# Altium project hub_usb_2_0_3_0.PrjPcb
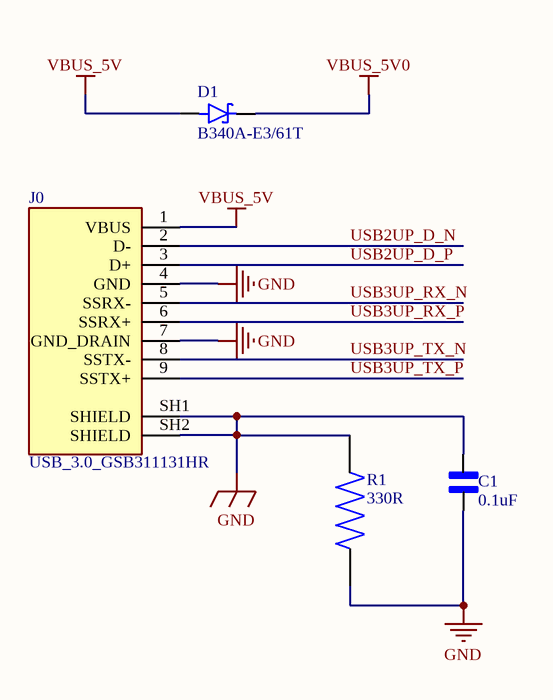
[diagram p0: type_A_input.SchDoc]
4 sheets, 101 parts. Net scope: global (net labels, ports and power ports of the same name join across sheets).
Board file: hub_usb.PcbDoc
Sheets:
  type_A_input.SchDoc
  Nguon.SchDoc
  vi_dieu_khien.SchDoc
  type_A_output.SchDoc

## Sheet type_A_input.SchDoc
size A; SheetNumber: 1; SheetTotal: 4

### Parts
C1  0.1uF  [CAPC1608X94N]
D1  B340A-E3/61T  [DIOM5126X229N]
J0  USB_3.0_GSB311131HR  [USB 3.0]
R1  330R  [RES_ERJU03J474V]

### Nets
GND: C1.1 C1.2 J0.4(GND) J0.7(GND_DRAIN) J0.SH1(SHIELD) J0.SH2(SHIELD) R1.1 R1.2
VBUS_5V: D1.A J0.1(VBUS)
VBUS_5V0: D1.C
USB2UP_D_N: J0.2(D-)
USB2UP_D_P: J0.3(D+)
USB3UP_RX_N: J0.5(SSRX-)
USB3UP_RX_P: J0.6(SSRX+)
USB3UP_TX_N: J0.8(SSTX-)
USB3UP_TX_P: J0.9(SSTX+)

### Library data of the parts
C1 = cap_0603_VJ0603D3R9DXCAP: cap 0603 (1608 Metric); MF: Vishay Vitramon; SnapEDA_Link: https://www.snapeda.com/parts/VJ0603D3R9DXCAP/Vishay/view-part/?ref=snap; Package: 1608 Vishay Vitramon; Value: *; MP: VJ0603D3R9DXCAP; Check_prices: https://www.snapeda.com/parts/VJ0603D3R9DXCAP/Vishay/view-part/?ref=eda
D1 = B340A-E3/61T: Diode Schottky 40 V 3A Surface Mount DO-214AC (SMA); MF: Vishay Semiconductor; SnapEDA_Link: https://www.snapeda.com/parts/B340A-E3/61T/Vishay/view-part/?ref=snap; Package: DO-214 Vishay Semiconductor; Value: *; MP: B340A-E3/61T; Check_prices: https://www.snapeda.com/parts/B340A-E3/61T/Vishay/view-part/?ref=eda
J0 = USB_3.0_GSB311131HR: USB-A _USB TYPE-A_ USB 3.0 _USB 3.1 Gen 1, Superspeed_ Receptacle Connector 9 Position Through Hole, Right Angle / GSB311131HR; MF: Amphenol ICC; Package: None; Digi-Key_Purchase_URL: https://www.digikey.ru/product-detail/en/amphenol-icc-commercial-products/GSB311131HR/GSB311131HR-ND/2187173?utm_source=snapeda&utm_medium=aggregator&utm_campaign=symbol; Value: *; MP: GSB311131HR; SnapEDA_Link: https://www.snapeda.com/parts/GSB311131HR/Amphenol%20FCI/view-part/229215/?ref=snap; Digi-Key_Part_Number: GSB311131HR-ND
R1 = res_0603_ERJU03J474V: 0603 Anti-Sulfurated; MF: Panasonic; SnapEDA_Link: https://www.snapeda.com/parts/ERJU03J474V/Panasonic/view-part/?ref=snap; Package: 1608-2 Panasonic; Value: *; MP: ERJU03J474V; Check_prices: https://www.snapeda.com/parts/ERJU03J474V/Panasonic/view-part/?ref=eda

## Sheet Nguon.SchDoc
size 381 x 241 mm; SheetNumber: 2; SheetTotal: 4
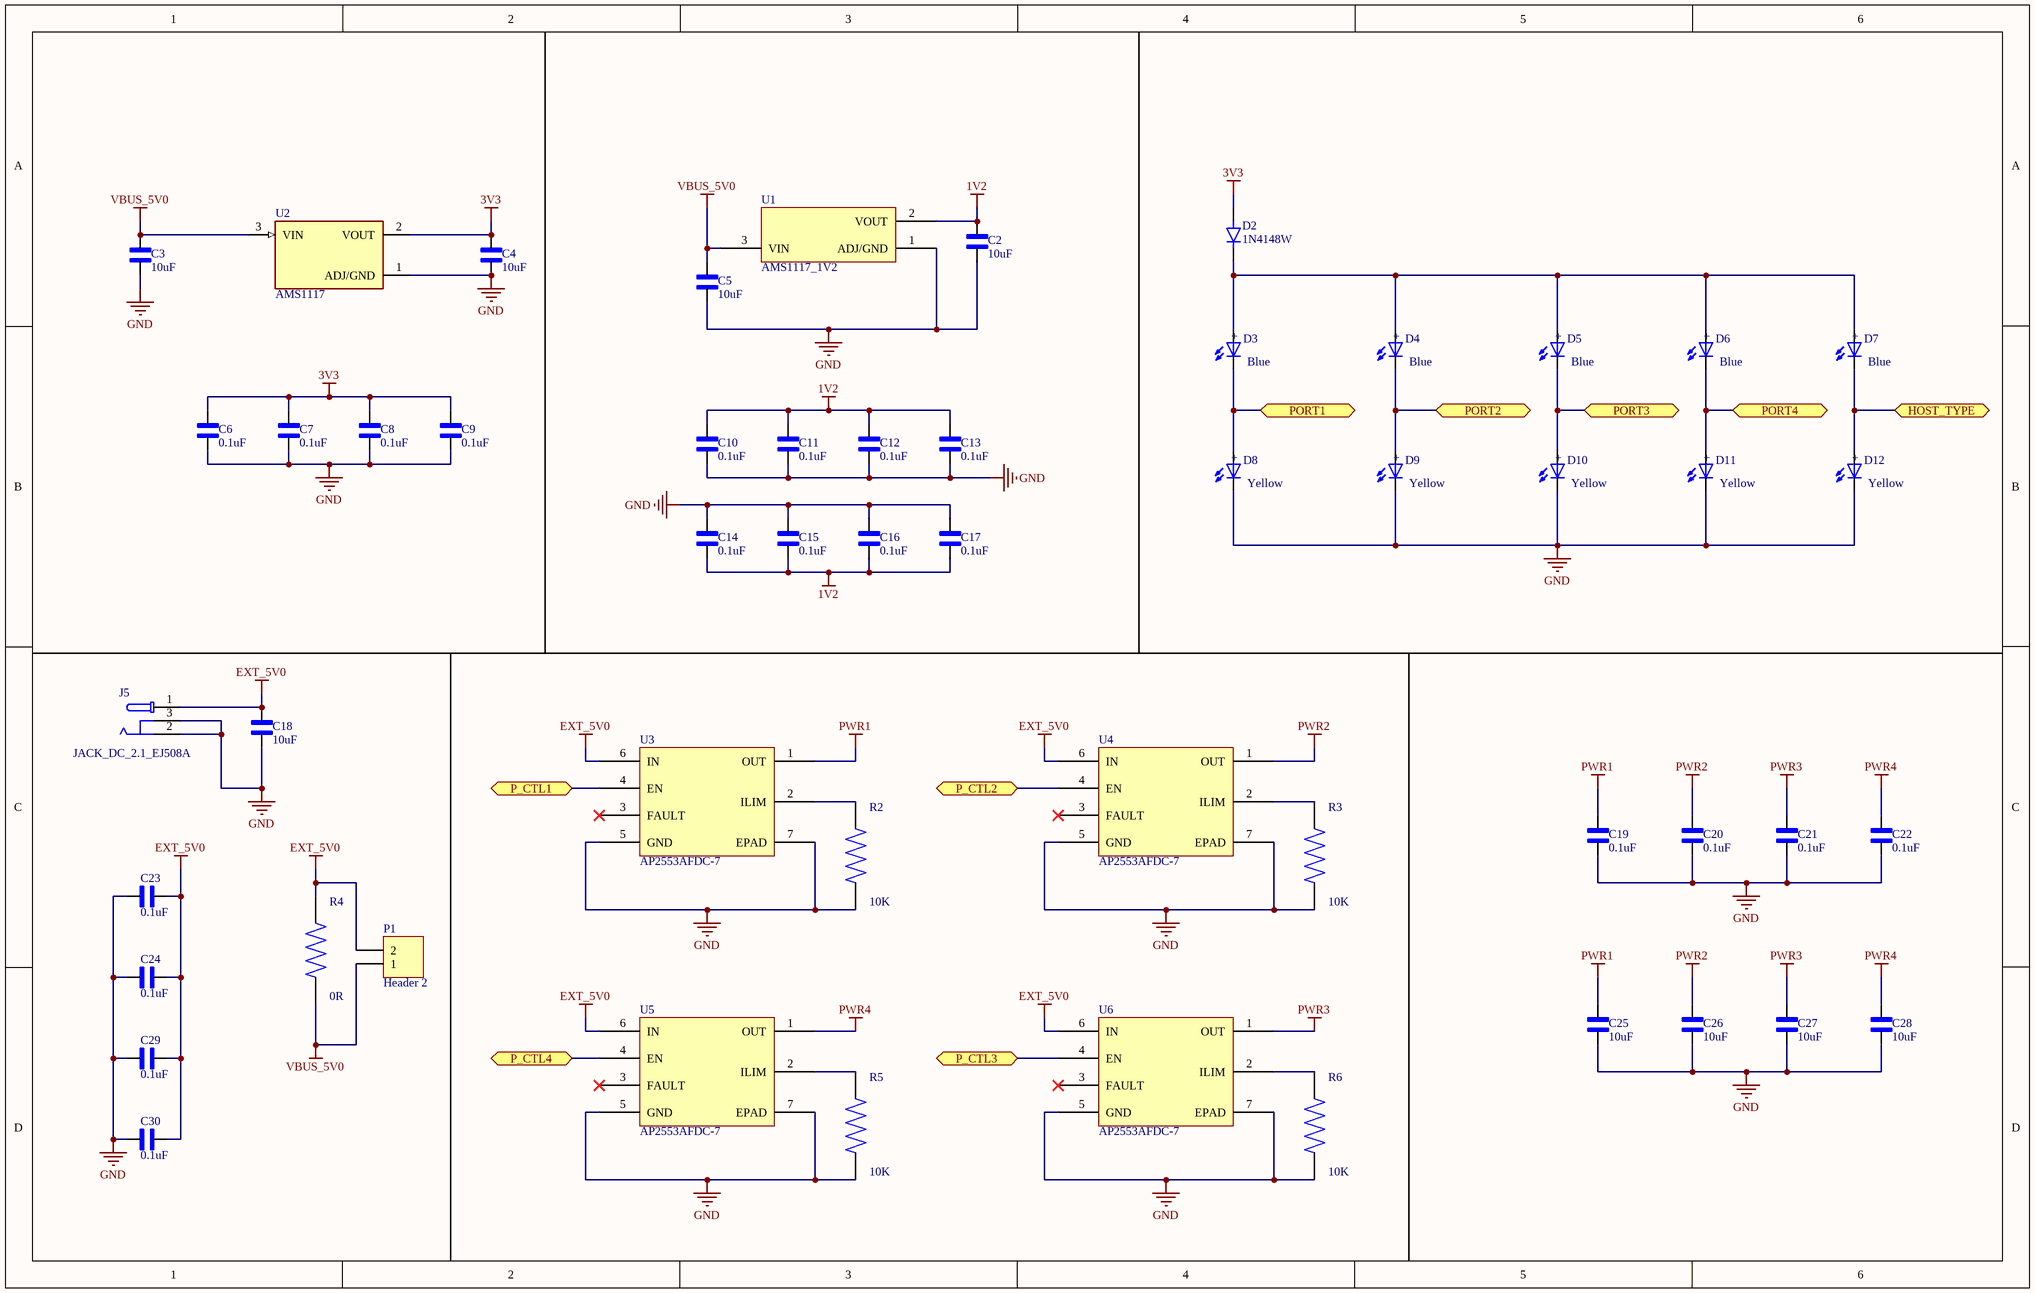
[diagram p1: Nguon.SchDoc]

### Parts
C2  10uF  [CAPC3216X170N]
C3  10uF  [CAPC3216X170N]
C4  10uF  [CAPC3216X170N]
C5  10uF  [CAPC3216X170N]
C6  0.1uF  [CAPC1608X94N]
C7  0.1uF  [CAPC1608X94N]
C8  0.1uF  [CAPC1608X94N]
C9  0.1uF  [CAPC1608X94N]
C10  0.1uF  [CAPC1608X94N]
C11  0.1uF  [CAPC1608X94N]
C12  0.1uF  [CAPC1608X94N]
C13  0.1uF  [CAPC1608X94N]
C14  0.1uF  [CAPC1608X94N]
C15  0.1uF  [CAPC1608X94N]
C16  0.1uF  [CAPC1608X94N]
C17  0.1uF  [CAPC1608X94N]
C18  10uF  [CAPC3216X170N]
C19  0.1uF  [CAPC1608X94N]
C20  0.1uF  [CAPC1608X94N]
C21  0.1uF  [CAPC1608X94N]
C22  0.1uF  [CAPC1608X94N]
C23  0.1uF  [CAPC1608X94N]
C24  0.1uF  [CAPC1608X94N]
C25  10uF  [CAPC3216X170N]
C26  10uF  [CAPC3216X170N]
C27  10uF  [CAPC3216X170N]
C28  10uF  [CAPC3216X170N]
C29  0.1uF  [CAPC1608X94N]
C30  0.1uF  [CAPC1608X94N]
D2  1N4148W  [SODFL3816X120N]
D3  Blue  [WL-SMCW_1206]
D4  Blue  [WL-SMCW_1206]
D5  Blue  [WL-SMCW_1206]
D6  Blue  [WL-SMCW_1206]
D7  Blue  [WL-SMCW_1206]
D8  Yellow  [WL-SMCW_1206]
D9  Yellow  [WL-SMCW_1206]
D10  Yellow  [WL-SMCW_1206]
D11  Yellow  [WL-SMCW_1206]
D12  Yellow  [WL-SMCW_1206]
J5  JACK_DC_2.1_EJ508A  [MPD_EJ508A]
P1  Header 2  [HDR1X2]
R2  10K  [RES_ERJU03J474V]
R3  10K  [RES_ERJU03J474V]
R4  0R  [RES_ERJU03J474V]
R5  10K  [RES_ERJU03J474V]
R6  10K  [RES_ERJU03J474V]
U1  AMS1117_1V2  [AMS1117_1V2]
U2  AMS1117  [SOT229P700X180-4N]
U3  AP2553AFDC-7  [AP2553AFDC-7]
U4  AP2553AFDC-7  [AP2553AFDC-7]
U5  AP2553AFDC-7  [AP2553AFDC-7]
U6  AP2553AFDC-7  [AP2553AFDC-7]

### Ports
HOST_TYPE (bidir), P_CTL1 (bidir), P_CTL2 (bidir), P_CTL3 (bidir), P_CTL4 (bidir), PORT1 (bidir), PORT2 (bidir), PORT3 (bidir), PORT4 (bidir)

### Nets
1V2: C2.2 C10.2 C11.2 C12.2 C13.2 C14.1 C15.1 C16.1 C17.1 U1.2(VOUT)
3V3: C4.2 C6.2 C7.2 C8.2 C9.2 D2.A U2.2(VOUT)
EXT_5V0: C18.2 C23.2 C24.2 C29.2 C30.2 J5.1 P1.2 R4.2 U3.6(IN) U4.6(IN) U5.6(IN) U6.6(IN)
GND: C2.1 C3.1 C4.1 C5.1 C6.1 C7.1 C8.1 C9.1 C10.1 C11.1 C12.1 C13.1 C14.2 C15.2 C16.2 C17.2 C18.1 C19.1 C20.1 C21.1 C22.1 C23.1 C24.1 C25.1 C26.1 C27.1 C28.1 C29.1 C30.1 D8.1(NEG) D9.1(NEG) D10.1(NEG) D11.1(NEG) D12.1(NEG) J5.2 J5.3 R2.1 R3.1 R5.1 R6.1 U1.1(ADJ/GND) U2.1(ADJ/GND) U3.5(GND) U3.7(EPAD) U4.5(GND) U4.7(EPAD) U5.5(GND) U5.7(EPAD) U6.5(GND) U6.7(EPAD)
PWR1: C19.2 C25.2 U3.1(OUT)
PWR2: C20.2 C26.2 U4.1(OUT)
PWR3: C21.2 C27.2 U6.1(OUT)
PWR4: C22.2 C28.2 U5.1(OUT)
VBUS_5V0: C3.2 C5.2 P1.1 R4.1 U1.3(VIN) U2.3(VIN)
NetD2_C: D2.C(K) D3.2(POS) D4.2(POS) D5.2(POS) D6.2(POS) D7.2(POS)
NetD3_1: D3.1(NEG) D8.2(POS) ; port PORT1
NetD4_1: D4.1(NEG) D9.2(POS) ; port PORT2
NetD5_1: D5.1(NEG) D10.2(POS) ; port PORT3
NetD6_1: D6.1(NEG) D11.2(POS) ; port PORT4
NetD7_1: D7.1(NEG) D12.2(POS) ; port HOST_TYPE
NetR2_2: R2.2 U3.2(ILIM)
NetR3_2: R3.2 U4.2(ILIM)
NetR5_2: R5.2 U5.2(ILIM)
NetR6_2: R6.2 U6.2(ILIM)
NetU3_4: U3.4(EN) ; port P_CTL1
NetU4_4: U4.4(EN) ; port P_CTL2
NetU5_4: U5.4(EN) ; port P_CTL4
NetU6_4: U6.4(EN) ; port P_CTL3

Not connected (* = marked no-connect by the designer): U3 3(FAULT)*; U4 3(FAULT)*; U5 3(FAULT)*; U6 3(FAULT)*

### Notes on the sheet
- (in symbol WL-SMCW_1206) +

### Library data of the parts
C2-C5 C18 C25-C28 = cap_1206_VJ1206A330JXCAP: cap 1206 (3216 Metric); MF: Vishay Vitramon; SnapEDA_Link: https://www.snapeda.com/parts/VJ1206A330JXCAP/Vishay/view-part/?ref=snap; Package: 3216 Vishay Vitramon; Value: *; MP: VJ1206A330JXCAP; Check_prices: https://www.snapeda.com/parts/VJ1206A330JXCAP/Vishay/view-part/?ref=eda
C6-C17 C19-C24 C29 C30 = cap_0603_VJ0603D3R9DXCAP: as C1 on sheet type_A_input; SnapEDA_Link: https://www.snapeda.com/parts/VJ0603D3R9DXCAP/Vishay/view-part/?ref=snap; Package: 1608 Vishay Vitramon; Value: *; MP: VJ0603D3R9DXCAP; Check_prices: https://www.snapeda.com/parts/VJ0603D3R9DXCAP/Vishay/view-part/?ref=eda
D2 = 1N4148W: Small Signal Diode, SOD-123F, 100V, 0.15A, 150Â°C; MF: Diotec Semiconductor; SnapEDA_Link: https://www.snapeda.com/parts/1N4148W/Diotec/view-part/?ref=snap; Package: SOD-123F Diotec; Value: *; MP: 1N4148W; Check_prices: https://www.snapeda.com/parts/1N4148W/Diotec/view-part/?ref=eda
D3-D7 = WL-SMCW_1206: 1206, Blue Typ.(@20mA): 470nm, 145mcd, 3.2V, 140Â° InGaN; MF: Wurth Electronics; MP: 150120BS75000; SnapEDA_Link: https://www.snapeda.com/parts/150120BS75000/Wurth+Electronics/view-part/?ref=snap; Package: 1206 Wurth Electronics; Value: *; Check_prices: https://www.snapeda.com/parts/150120BS75000/Wurth+Electronics/view-part/?ref=eda
D8-D12 = WL-SMCW_1206: 1206,  Yellow Typ.(@20mA): 470nm, 145mcd, 3.2V, 140Â° InGaN; MF: Wurth Electronics; MP: 150120BS75000; SnapEDA_Link: https://www.snapeda.com/parts/150120BS75000/Wurth+Electronics/view-part/?ref=snap; Package: 1206 Wurth Electronics; Value: *; Check_prices: https://www.snapeda.com/parts/150120BS75000/Wurth+Electronics/view-part/?ref=eda
J5 = JACK_DC_2.1_EJ508A: Power Barrel Connector Jack 2.10mm ID _0.083_, 5.50mm OD _0.217_ Through Hole, Right Angle / EJ508A; MF: MPD; Package: Non-Standard MPD; Value: *; SnapEDA_Link: https://www.snapeda.com/parts/EJ508A/MPD%20%28Memory%20Protection%20Devices%29/view-part/474399/?ref=snap; Price: None; MP: EJ508A; Availability: Unavailable
P1 = Header 2: Header, 2-Pin; LatestRevisionDate: 17-Jul-2002; LatestRevisionNote: Re-released for DXP Platform.; Publisher: Altium Limited
R2-R6 = res_0603_ERJU03J474V: 0603 Anti-Sulfurated; MF: Panasonic; SnapEDA_Link: https://www.snapeda.com/parts/ERJU03J474V/Panasonic/view-part/?ref=snap; Package: 1608-2 Panasonic; Value: *; MP: ERJU03J474V; Check_prices: https://www.snapeda.com/parts/ERJU03J474V/Panasonic/view-part/?ref=eda
U2 = AMS1117: 1A LOW DROPOUT VOLTAGE REGULATOR SOT-223; MF: Advanced Monolithic Systems; SnapEDA_Link: https://www.snapeda.com/parts/AMS1117/Advanced+Monolithic+Systems/view-part/?ref=snap; Package: SOT-223 Seeed Technology; Value: *; MP: AMS1117; Check_prices: https://www.snapeda.com/parts/AMS1117/Advanced+Monolithic+Systems/view-part/?ref=eda

## Sheet vi_dieu_khien.SchDoc
size D; SheetNumber: 3; SheetTotal: 4
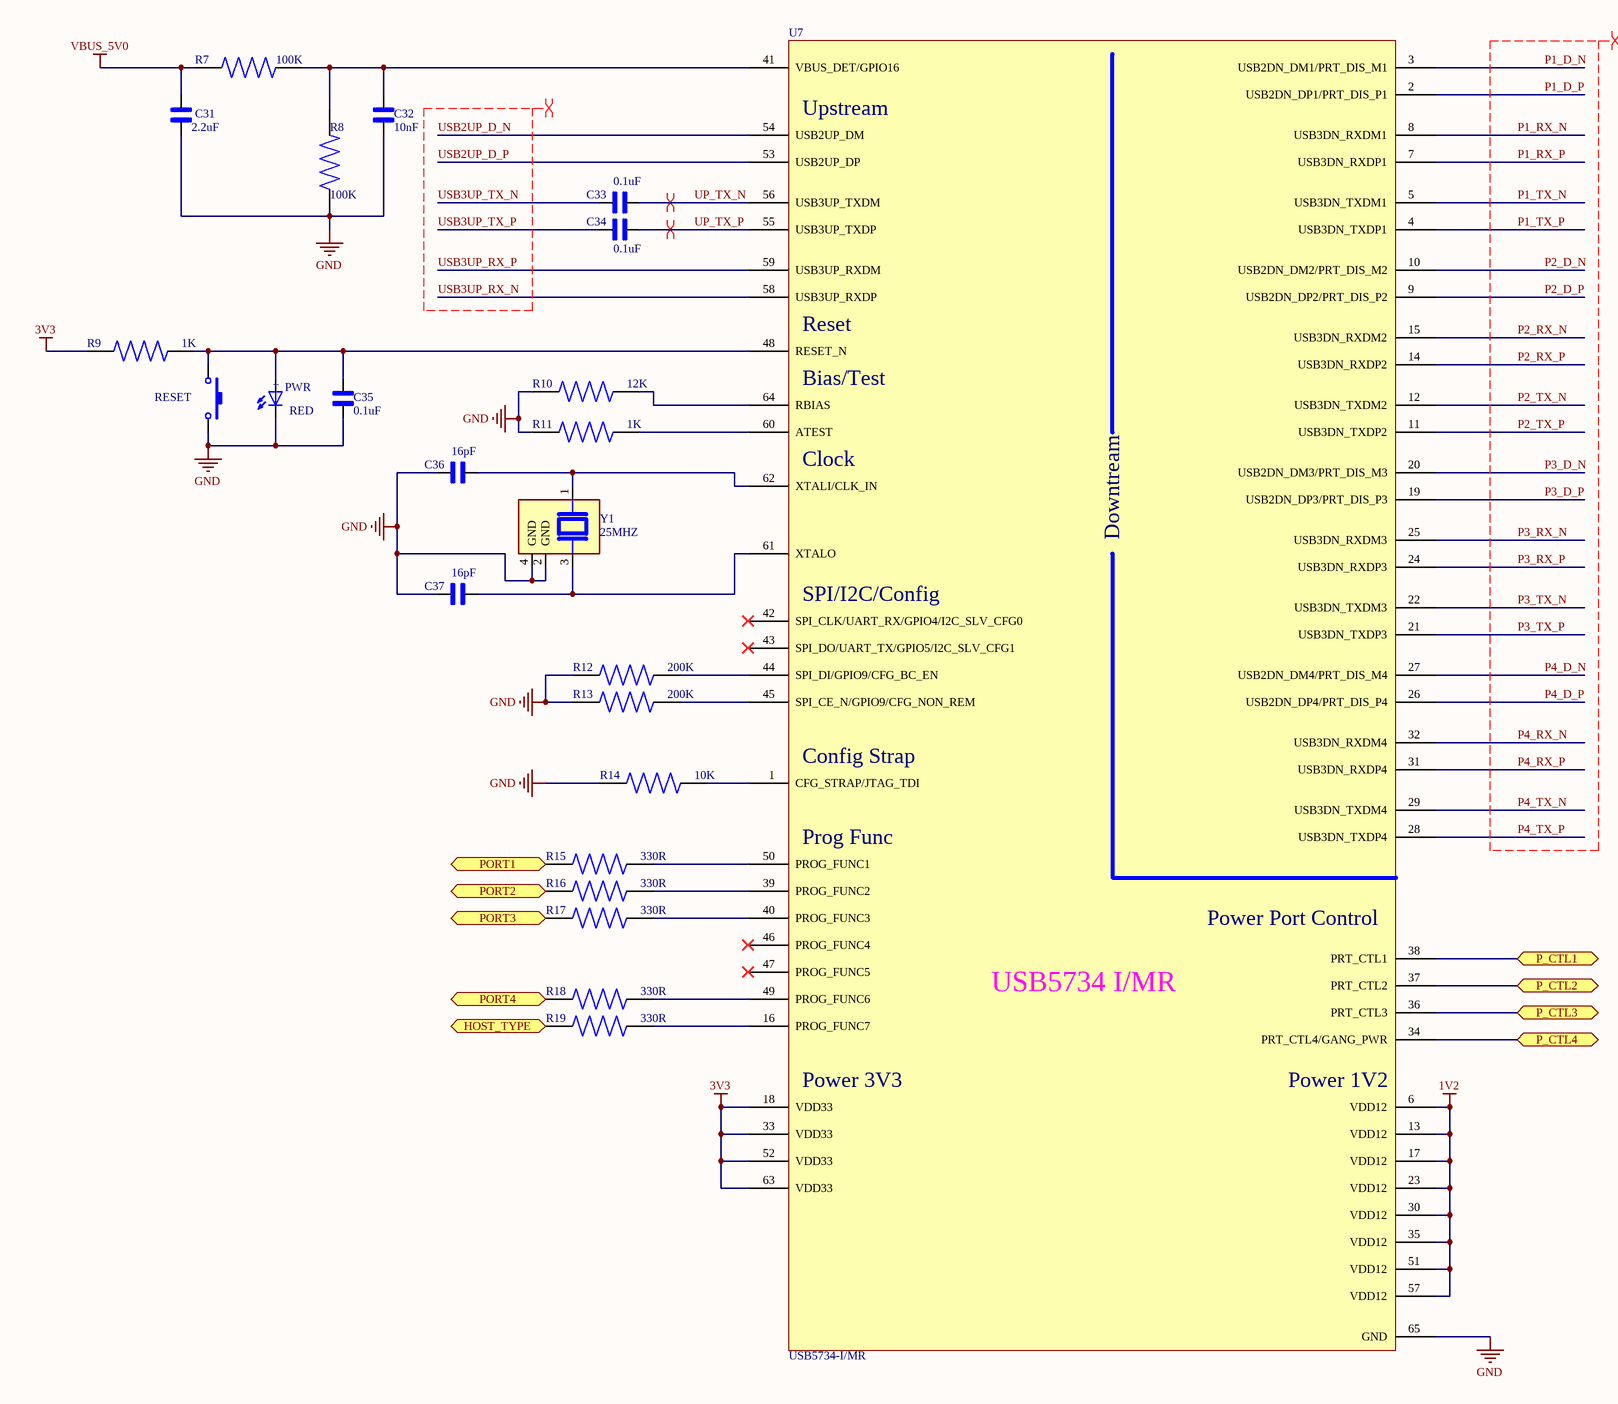
[diagram p2: vi_dieu_khien.SchDoc]

### Parts
C31  2.2uF  [CAPC3216X170N]
C32  10nF  [CAPC1608X94N]
C33  0.1uF  [CAPC1608X94N]
C34  0.1uF  [CAPC1608X94N]
C35  0.1uF  [CAPC1608X94N]
C36  16pF  [CAPC1608X94N]
C37  16pF  [CAPC1608X94N]
PWR  RED  [WL-SMCW_1206]
R7  100K  [RES_ERJU03J474V]
R8  100K  [RES_ERJU03J474V]
R9  1K  [RES_ERJU03J474V]
R10  12K  [RES_ERJU03J474V]
R11  1K  [RES_ERJU03J474V]
R12  200K  [RES_ERJU03J474V]
R13  200K  [RES_ERJU03J474V]
R14  10K  [RES_ERJU03J474V]
R15  330R  [RES_ERJU03J474V]
R16  330R  [RES_ERJU03J474V]
R17  330R  [RES_ERJU03J474V]
R18  330R  [RES_ERJU03J474V]
R19  330R  [RES_ERJU03J474V]
RESET  Nut Nhan 2 Chan SMD 3x6x2.5  [PCBComponent_1]  (value not drawn)
U7  USB5734-I/MR  [USB5734-I/MR]
Y1  25MHZ  [XTAL_ABM8G-25.000MHZ-B4Y-T]

### Ports
HOST_TYPE (bidir), P_CTL1 (bidir), P_CTL2 (bidir), P_CTL3 (bidir), P_CTL4 (bidir), PORT1 (bidir), PORT2 (bidir), PORT3 (bidir), PORT4 (bidir)

### Nets
1V2: U7.6(VDD12) U7.13(VDD12) U7.17(VDD12) U7.23(VDD12) U7.30(VDD12) U7.35(VDD12) U7.51(VDD12) U7.57(VDD12)
3V3: R9.1 U7.18(VDD33) U7.33(VDD33) U7.52(VDD33) U7.63(VDD33)
GND: C31.1 C32.1 C35.1 C36.1 C37.1 PWR.1(NEG) R8.2 R10.1 R11.1 R12.1 R13.1 R14.1 RESET.2 U7.65(GND) Y1.2(GND) Y1.4(GND)
VBUS_5V0: C31.2 R7.1
P1_D_N: U7.3(USB2DN_DM1/PRT_DIS_M1)
P1_D_P: U7.2(USB2DN_DP1/PRT_DIS_P1)
P1_RX_N: U7.8(USB3DN_RXDM1)
P1_RX_P: U7.7(USB3DN_RXDP1)
P1_TX_N: U7.5(USB3DN_TXDM1)
P1_TX_P: U7.4(USB3DN_TXDP1)
P2_D_N: U7.10(USB2DN_DM2/PRT_DIS_M2)
P2_D_P: U7.9(USB2DN_DP2/PRT_DIS_P2)
P2_RX_N: U7.15(USB3DN_RXDM2)
P2_RX_P: U7.14(USB3DN_RXDP2)
P2_TX_N: U7.12(USB3DN_TXDM2)
P2_TX_P: U7.11(USB3DN_TXDP2)
P3_D_N: U7.20(USB2DN_DM3/PRT_DIS_M3)
P3_D_P: U7.19(USB2DN_DP3/PRT_DIS_P3)
P3_RX_N: U7.25(USB3DN_RXDM3)
P3_RX_P: U7.24(USB3DN_RXDP3)
P3_TX_N: U7.22(USB3DN_TXDM3)
P3_TX_P: U7.21(USB3DN_TXDP3)
P4_D_N: U7.27(USB2DN_DM4/PRT_DIS_M4)
P4_D_P: U7.26(USB2DN_DP4/PRT_DIS_P4)
P4_RX_N: U7.32(USB3DN_RXDM4)
P4_RX_P: U7.31(USB3DN_RXDP4)
P4_TX_N: U7.29(USB3DN_TXDM4)
P4_TX_P: U7.28(USB3DN_TXDP4)
UP_TX_N: C33.2 U7.56(USB3UP_TXDM)
UP_TX_P: C34.2 U7.55(USB3UP_TXDP)
USB2UP_D_N: U7.54(USB2UP_DM)
USB2UP_D_P: U7.53(USB2UP_DP)
USB3UP_RX_N: U7.58(USB3UP_RXDP)
USB3UP_RX_P: U7.59(USB3UP_RXDM)
USB3UP_TX_N: C33.1
USB3UP_TX_P: C34.1
NetC32_2: C32.2 R7.2 R8.1 U7.41(VBUS_DET/GPIO16)
NetC35_2: C35.2 PWR.2(POS) R9.2 RESET.1 U7.48(RESET_N)
NetC36_2: C36.2 U7.62(XTALI/CLK_IN) Y1.1
NetC37_2: C37.2 U7.61(XTALO) Y1.3
NetD3_1: R15.1 ; port PORT1
NetD4_1: R16.1 ; port PORT2
NetD5_1: R17.1 ; port PORT3
NetD6_1: R18.1 ; port PORT4
NetD7_1: R19.1 ; port HOST_TYPE
NetR10_2: R10.2 U7.64(RBIAS)
NetR11_2: R11.2 U7.60(ATEST)
NetR12_2: R12.2 U7.44(SPI_DI/GPIO9/CFG_BC_EN)
NetR13_2: R13.2 U7.45(SPI_CE_N/GPIO9/CFG_NON_REM)
NetR14_2: R14.2 U7.1(CFG_STRAP/JTAG_TDI)
NetR15_2: R15.2 U7.50(PROG_FUNC1)
NetR16_2: R16.2 U7.39(PROG_FUNC2)
NetR17_2: R17.2 U7.40(PROG_FUNC3)
NetR18_2: R18.2 U7.49(PROG_FUNC6)
NetR19_2: R19.2 U7.16(PROG_FUNC7)
NetU3_4: U7.38(PRT_CTL1) ; port P_CTL1
NetU4_4: U7.37(PRT_CTL2) ; port P_CTL2
NetU5_4: U7.34(PRT_CTL4/GANG_PWR) ; port P_CTL4
NetU6_4: U7.36(PRT_CTL3) ; port P_CTL3

Not connected (* = marked no-connect by the designer): U7 42(SPI_CLK/UART_RX/GPIO4/I2C_SLV_CFG0)* 43(SPI_DO/UART_TX/GPIO5/I2C_SLV_CFG1)* 46(PROG_FUNC4)* 47(PROG_FUNC5)*

### Layout directives
differential pair: P1_D_N, P1_D_P, P1_RX_N, P1_RX_P, P1_TX_N, P1_TX_P, P2_D_N, P2_D_P, P2_RX_N, P2_RX_P, P2_TX_N, P2_TX_P, P3_D_N, P3_D_P, P3_RX_N, P3_RX_P, P3_TX_N, P3_TX_P, P4_D_N, P4_D_P, P4_RX_N, P4_RX_P, P4_TX_N, P4_TX_P, UP_TX_N, UP_TX_P, USB2UP_D_N, USB2UP_D_P, USB3UP_RX_N, USB3UP_RX_P, USB3UP_TX_N, USB3UP_TX_P

### Notes on the sheet
- (in symbol USB5734-I/MR) Upstream; Reset; Bias/Test; Clock; Downtream; SPI/I2C/Config; Config Strap; Prog Func; Power Port Control; USB5734 I/MR; Power 3V3; Power 1V2
- (in symbol WL-SMCW_1206) +

### Library data of the parts
C31 = cap_1206_VJ1206A330JXCAP: as C2 on sheet Nguon; SnapEDA_Link: https://www.snapeda.com/parts/VJ1206A330JXCAP/Vishay/view-part/?ref=snap; Package: 3216 Vishay Vitramon; Value: *; MP: VJ1206A330JXCAP; Check_prices: https://www.snapeda.com/parts/VJ1206A330JXCAP/Vishay/view-part/?ref=eda
C32-C37 = cap_0603_VJ0603D3R9DXCAP: as C1 on sheet type_A_input; SnapEDA_Link: https://www.snapeda.com/parts/VJ0603D3R9DXCAP/Vishay/view-part/?ref=snap; Package: 1608 Vishay Vitramon; Value: *; MP: VJ0603D3R9DXCAP; Check_prices: https://www.snapeda.com/parts/VJ0603D3R9DXCAP/Vishay/view-part/?ref=eda
PWR = WL-SMCW_1206: 1206, RED Typ.(@20mA): 470nm, 145mcd, 3.2V, 140Â° InGaN; MF: Wurth Electronics; MP: 150120BS75000; SnapEDA_Link: https://www.snapeda.com/parts/150120BS75000/Wurth+Electronics/view-part/?ref=snap; Package: 1206 Wurth Electronics; Value: *; Check_prices: https://www.snapeda.com/parts/150120BS75000/Wurth+Electronics/view-part/?ref=eda
R7-R19 = res_0603_ERJU03J474V: 0603 Anti-Sulfurated; MF: Panasonic; SnapEDA_Link: https://www.snapeda.com/parts/ERJU03J474V/Panasonic/view-part/?ref=snap; Package: 1608-2 Panasonic; Value: *; MP: ERJU03J474V; Check_prices: https://www.snapeda.com/parts/ERJU03J474V/Panasonic/view-part/?ref=eda
RESET = Nut Nhan 2 Chan SMD 3x6x2.5: Ma_Hang: MH001036; Ten: Nút Nhấn 2 Chân 3x6x2.5MM SMD
U7 = USB5734-I/MR: USB5734-I/MR / USB Hub Controller USB 3.0 I2C, SPI, UART Interface 64-VQFN (9x9)
Y1 = Thach_anh_3.2x2.5_ABM8G-25.000MHZ-B4Y-T: 25 MHz Â±30ppm Crystal 10pF 60 Ohms 4-SMD, No Lead / ABM8G-25.000MHZ-B4Y-T; MF: Abracon; Value: *; SnapEDA_Link: https://www.snapeda.com/parts/ABM8G-25.000MHZ-B4Y-T/Abracon+LLC/view-part/?ref=snap; MP: ABM8G-25.000MHZ-B4Y-T; Check_prices: https://www.snapeda.com/parts/ABM8G-25.000MHZ-B4Y-T/Abracon+LLC/view-part/?ref=eda; Availability: In Stock; Price: None; Purchase-URL: https://pricing.snapeda.com/search/part/ABM8G-25.000MHZ-B4Y-T/?ref=eda; Package: SMD-4 Abracon

## Sheet type_A_output.SchDoc
size A; SheetNumber: 4; SheetTotal: 4
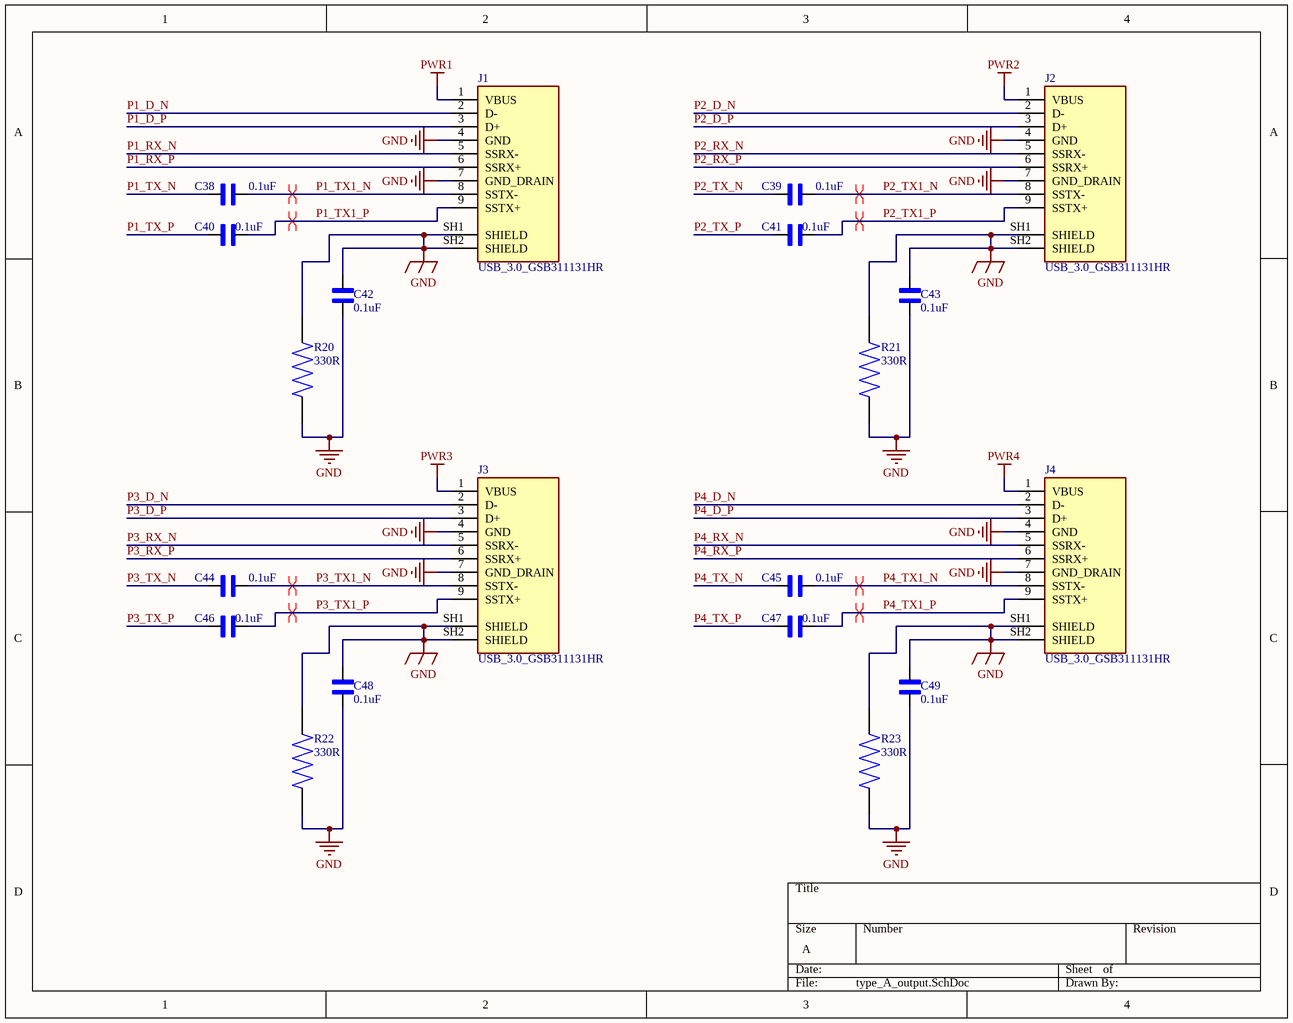
[diagram p3: type_A_output.SchDoc]

### Parts
C38  0.1uF  [CAPC1608X94N]
C39  0.1uF  [CAPC1608X94N]
C40  0.1uF  [CAPC1608X94N]
C41  0.1uF  [CAPC1608X94N]
C42  0.1uF  [CAPC1608X94N]
C43  0.1uF  [CAPC1608X94N]
C44  0.1uF  [CAPC1608X94N]
C45  0.1uF  [CAPC1608X94N]
C46  0.1uF  [CAPC1608X94N]
C47  0.1uF  [CAPC1608X94N]
C48  0.1uF  [CAPC1608X94N]
C49  0.1uF  [CAPC1608X94N]
J1  USB_3.0_GSB311131HR  [USB 3.0]
J2  USB_3.0_GSB311131HR  [USB 3.0]
J3  USB_3.0_GSB311131HR  [USB 3.0]
J4  USB_3.0_GSB311131HR  [USB 3.0]
R20  330R  [RES_ERJU03J474V]
R21  330R  [RES_ERJU03J474V]
R22  330R  [RES_ERJU03J474V]
R23  330R  [RES_ERJU03J474V]

### Nets
GND: C42.1 C42.2 C43.1 C43.2 C48.1 C48.2 C49.1 C49.2 J1.4(GND) J1.7(GND_DRAIN) J1.SH1(SHIELD) J1.SH2(SHIELD) J2.4(GND) J2.7(GND_DRAIN) J2.SH1(SHIELD) J2.SH2(SHIELD) J3.4(GND) J3.7(GND_DRAIN) J3.SH1(SHIELD) J3.SH2(SHIELD) J4.4(GND) J4.7(GND_DRAIN) J4.SH1(SHIELD) J4.SH2(SHIELD) R20.1 R20.2 R21.1 R21.2 R22.1 R22.2 R23.1 R23.2
PWR1: J1.1(VBUS)
PWR2: J2.1(VBUS)
PWR3: J3.1(VBUS)
PWR4: J4.1(VBUS)
P1_D_N: J1.2(D-)
P1_D_P: J1.3(D+)
P1_RX_N: J1.5(SSRX-)
P1_RX_P: J1.6(SSRX+)
P1_TX1_N: C38.2 J1.8(SSTX-)
P1_TX1_P: C40.2 J1.9(SSTX+)
P1_TX_N: C38.1
P1_TX_P: C40.1
P2_D_N: J2.2(D-)
P2_D_P: J2.3(D+)
P2_RX_N: J2.5(SSRX-)
P2_RX_P: J2.6(SSRX+)
P2_TX1_N: C39.2 J2.8(SSTX-)
P2_TX1_P: C41.2 J2.9(SSTX+)
P2_TX_N: C39.1
P2_TX_P: C41.1
P3_D_N: J3.2(D-)
P3_D_P: J3.3(D+)
P3_RX_N: J3.5(SSRX-)
P3_RX_P: J3.6(SSRX+)
P3_TX1_N: C44.2 J3.8(SSTX-)
P3_TX1_P: C46.2 J3.9(SSTX+)
P3_TX_N: C44.1
P3_TX_P: C46.1
P4_D_N: J4.2(D-)
P4_D_P: J4.3(D+)
P4_RX_N: J4.5(SSRX-)
P4_RX_P: J4.6(SSRX+)
P4_TX1_N: C45.2 J4.8(SSTX-)
P4_TX1_P: C47.2 J4.9(SSTX+)
P4_TX_N: C45.1
P4_TX_P: C47.1

### Layout directives
differential pair: P1_TX1_N, P1_TX1_P, P2_TX1_N, P2_TX1_P, P3_TX1_N, P3_TX1_P, P4_TX1_N, P4_TX1_P

### Library data of the parts
C38-C49 = cap_0603_VJ0603D3R9DXCAP: as C1 on sheet type_A_input; SnapEDA_Link: https://www.snapeda.com/parts/VJ0603D3R9DXCAP/Vishay/view-part/?ref=snap; Package: 1608 Vishay Vitramon; Value: *; MP: VJ0603D3R9DXCAP; Check_prices: https://www.snapeda.com/parts/VJ0603D3R9DXCAP/Vishay/view-part/?ref=eda
J1-J4 = USB_3.0_GSB311131HR: as J0 on sheet type_A_input; Package: None; Digi-Key_Purchase_URL: https://www.digikey.ru/product-detail/en/amphenol-icc-commercial-products/GSB311131HR/GSB311131HR-ND/2187173?utm_source=snapeda&utm_medium=aggregator&utm_campaign=symbol; Value: *; MP: GSB311131HR; SnapEDA_Link: https://www.snapeda.com/parts/GSB311131HR/Amphenol%20FCI/view-part/229215/?ref=snap; Digi-Key_Part_Number: GSB311131HR-ND
R20-R23 = res_0603_ERJU03J474V: 0603 Anti-Sulfurated; MF: Panasonic; SnapEDA_Link: https://www.snapeda.com/parts/ERJU03J474V/Panasonic/view-part/?ref=snap; Package: 1608-2 Panasonic; Value: *; MP: ERJU03J474V; Check_prices: https://www.snapeda.com/parts/ERJU03J474V/Panasonic/view-part/?ref=eda

## Nets that join several sheets
1V2: Nguon (10 pins), vi_dieu_khien (8 pins)
3V3: Nguon (7 pins), vi_dieu_khien (5 pins)
GND: type_A_input (8 pins), Nguon (50 pins), vi_dieu_khien (16 pins), type_A_output (32 pins)
PWR1: Nguon (C19.2 C25.2 U3.1), type_A_output (J1.1)
PWR2: Nguon (C20.2 C26.2 U4.1), type_A_output (J2.1)
PWR3: Nguon (C21.2 C27.2 U6.1), type_A_output (J3.1)
PWR4: Nguon (C22.2 C28.2 U5.1), type_A_output (J4.1)
VBUS_5V0: type_A_input (D1.C), Nguon (6 pins), vi_dieu_khien (C31.2 R7.1)
NetD3_1: Nguon (D3.1 D8.2), vi_dieu_khien (R15.1)
NetD4_1: Nguon (D4.1 D9.2), vi_dieu_khien (R16.1)
NetD5_1: Nguon (D5.1 D10.2), vi_dieu_khien (R17.1)
NetD6_1: Nguon (D6.1 D11.2), vi_dieu_khien (R18.1)
NetD7_1: Nguon (D7.1 D12.2), vi_dieu_khien (R19.1)
NetU3_4: Nguon (U3.4), vi_dieu_khien (U7.38)
NetU4_4: Nguon (U4.4), vi_dieu_khien (U7.37)
NetU5_4: Nguon (U5.4), vi_dieu_khien (U7.34)
NetU6_4: Nguon (U6.4), vi_dieu_khien (U7.36)
P1_D_N: vi_dieu_khien (U7.3), type_A_output (J1.2)
P1_D_P: vi_dieu_khien (U7.2), type_A_output (J1.3)
P1_RX_N: vi_dieu_khien (U7.8), type_A_output (J1.5)
P1_RX_P: vi_dieu_khien (U7.7), type_A_output (J1.6)
P1_TX_N: vi_dieu_khien (U7.5), type_A_output (C38.1)
P1_TX_P: vi_dieu_khien (U7.4), type_A_output (C40.1)
P2_D_N: vi_dieu_khien (U7.10), type_A_output (J2.2)
P2_D_P: vi_dieu_khien (U7.9), type_A_output (J2.3)
P2_RX_N: vi_dieu_khien (U7.15), type_A_output (J2.5)
P2_RX_P: vi_dieu_khien (U7.14), type_A_output (J2.6)
P2_TX_N: vi_dieu_khien (U7.12), type_A_output (C39.1)
P2_TX_P: vi_dieu_khien (U7.11), type_A_output (C41.1)
P3_D_N: vi_dieu_khien (U7.20), type_A_output (J3.2)
P3_D_P: vi_dieu_khien (U7.19), type_A_output (J3.3)
P3_RX_N: vi_dieu_khien (U7.25), type_A_output (J3.5)
P3_RX_P: vi_dieu_khien (U7.24), type_A_output (J3.6)
P3_TX_N: vi_dieu_khien (U7.22), type_A_output (C44.1)
P3_TX_P: vi_dieu_khien (U7.21), type_A_output (C46.1)
P4_D_N: vi_dieu_khien (U7.27), type_A_output (J4.2)
P4_D_P: vi_dieu_khien (U7.26), type_A_output (J4.3)
P4_RX_N: vi_dieu_khien (U7.32), type_A_output (J4.5)
P4_RX_P: vi_dieu_khien (U7.31), type_A_output (J4.6)
P4_TX_N: vi_dieu_khien (U7.29), type_A_output (C45.1)
P4_TX_P: vi_dieu_khien (U7.28), type_A_output (C47.1)
USB2UP_D_N: type_A_input (J0.2), vi_dieu_khien (U7.54)
USB2UP_D_P: type_A_input (J0.3), vi_dieu_khien (U7.53)
USB3UP_RX_N: type_A_input (J0.5), vi_dieu_khien (U7.58)
USB3UP_RX_P: type_A_input (J0.6), vi_dieu_khien (U7.59)
USB3UP_TX_N: type_A_input (J0.8), vi_dieu_khien (C33.1)
USB3UP_TX_P: type_A_input (J0.9), vi_dieu_khien (C34.1)